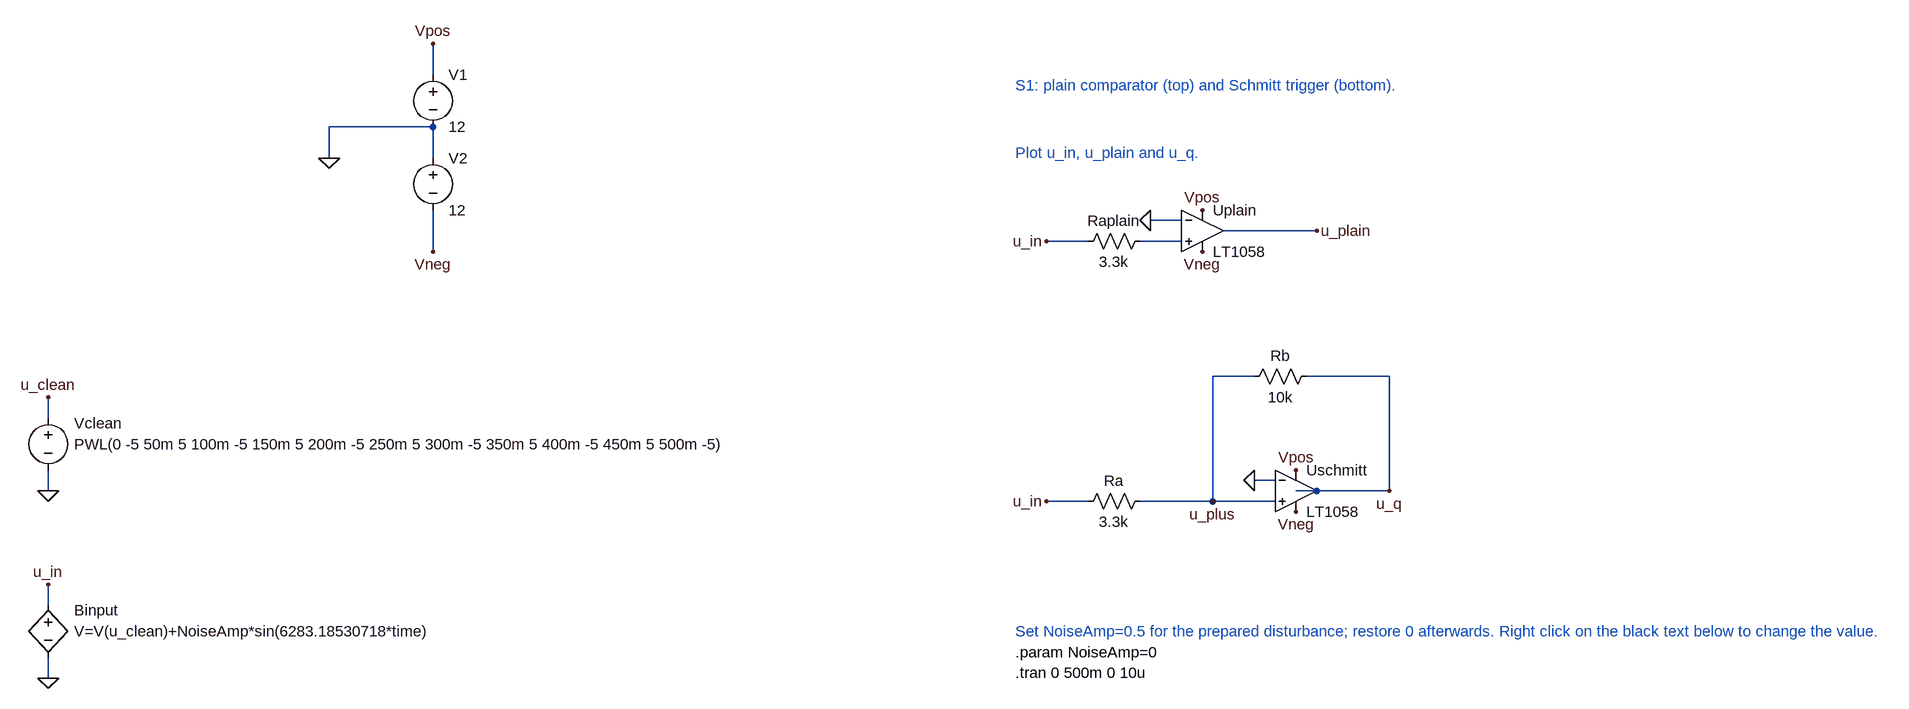
[diagram p0: schematic 6.1_comparator.asc]
6.1_comparator.asc, the LTspice schematic file:
Version 4.1
SHEET 1 3112 1100
WIRE -1024 -48 -1024 -96
WIRE -1024 32 -1184 32
WIRE -1184 80 -1184 32
WIRE -1024 80 -1024 32
WIRE 128 176 80 176
WIRE 336 192 192 192
WIRE -16 208 -80 208
WIRE 128 208 64 208
WIRE -1024 224 -1024 160
WIRE 240 416 176 416
WIRE 448 416 320 416
WIRE -1616 480 -1616 448
WIRE 272 576 240 576
WIRE -1616 592 -1616 560
WIRE 336 592 304 592
WIRE 448 592 448 416
WIRE 448 592 336 592
WIRE -16 608 -80 608
WIRE 176 608 176 416
WIRE 176 608 64 608
WIRE 272 608 176 608
WIRE -1616 768 -1616 736
WIRE -1616 880 -1616 848
FLAG -1024 -96 Vpos
FLAG -1024 224 Vneg
FLAG -1184 80 0
FLAG -1616 448 u_clean
FLAG -1616 592 0
FLAG -1616 736 u_in
FLAG -1616 880 0
FLAG 80 176 0
FLAG -80 208 u_in
FLAG 336 192 u_plain
FLAG 160 160 Vpos
FLAG 160 224 Vneg
FLAG 240 576 0
FLAG -80 608 u_in
FLAG 448 592 u_q
FLAG 176 608 u_plus
FLAG 304 560 Vpos
FLAG 304 624 Vneg
SYMBOL voltage -1024 -64 R0
SYMATTR InstName V1
SYMATTR Value 12
SYMBOL voltage -1024 64 R0
SYMATTR InstName V2
SYMATTR Value 12
SYMBOL voltage -1616 464 R0
WINDOW 0 40 24 Left 2
WINDOW 3 40 56 Left 2
SYMATTR InstName Vclean
SYMATTR Value PWL(0 -5 50m 5 100m -5 150m 5 200m -5 250m 5 300m -5 350m 5 400m -5 450m 5 500m -5)
SYMBOL bv -1616 752 R0
WINDOW 0 40 24 Left 2
WINDOW 3 40 56 Left 2
SYMATTR InstName Binput
SYMATTR Value V=V(u_clean)+NoiseAmp*sin(6283.18530718*time)
SYMBOL OpAmps\\LT1058 160 128 R0
SYMATTR InstName Uplain
SYMBOL res 80 192 R90
WINDOW 0 0 56 VBottom 2
WINDOW 3 32 56 VTop 2
SYMATTR InstName Raplain
SYMATTR Value 3.3k
SYMBOL OpAmps\\LT1058 304 528 R0
SYMATTR InstName Uschmitt
SYMBOL res 80 592 R90
WINDOW 0 0 56 VBottom 2
WINDOW 3 32 56 VTop 2
SYMATTR InstName Ra
SYMATTR Value 3.3k
SYMBOL res 336 400 R90
WINDOW 0 0 56 VBottom 2
WINDOW 3 32 56 VTop 2
SYMATTR InstName Rb
SYMATTR Value 10k
TEXT -128 -32 Left 2 ;S1: plain comparator (top) and Schmitt trigger (bottom).
TEXT -128 72 Left 2 ;Plot u_in, u_plain and u_q.
TEXT -128 840 Left 2 !.param NoiseAmp=0
TEXT -128 872 Left 2 !.tran 0 500m 0 10u
TEXT -128 808 Left 2 ;Set NoiseAmp=0.5 for the prepared disturbance; restore 0 afterwards. Right click on the black text below to change the value.

The netlist it stands for:
* 6.1_comparator.asc
V1 Vpos 0 12
V2 0 Vneg 12
Vclean u_clean 0 PWL(0 -5 50m 5 100m -5 150m 5 200m -5 250m 5 300m -5 350m 5 400m -5 450m 5 500m -5)
Binput u_in 0 V=V(u_clean)+NoiseAmp*sin(6283.18530718*time)
X§Uplain N001 0 Vpos Vneg u_plain LT1057  ; LT1058, pins In+ In- V+ V- OUT
Raplain N001 u_in 3.3k
X§Uschmitt u_plus 0 Vpos Vneg u_q LT1057  ; LT1058, pins In+ In- V+ V- OUT
Ra u_plus u_in 3.3k
Rb u_q u_plus 10k
* S1: plain comparator (top) and Schmitt trigger (bottom).
* Plot u_in, u_plain and u_q.
.param NoiseAmp=0
.tran 0 500m 0 10u
* Set NoiseAmp=0.5 for the prepared disturbance; restore 0 afterwards. Right click on the black text below to change the value.
.lib LTC.lib
.backanno
.end